# Altium schematic sheet peripherials.SchDoc (part 1 of 2)
size 420 x 297 mm; SheetNumber: 5; SheetTotal: 5
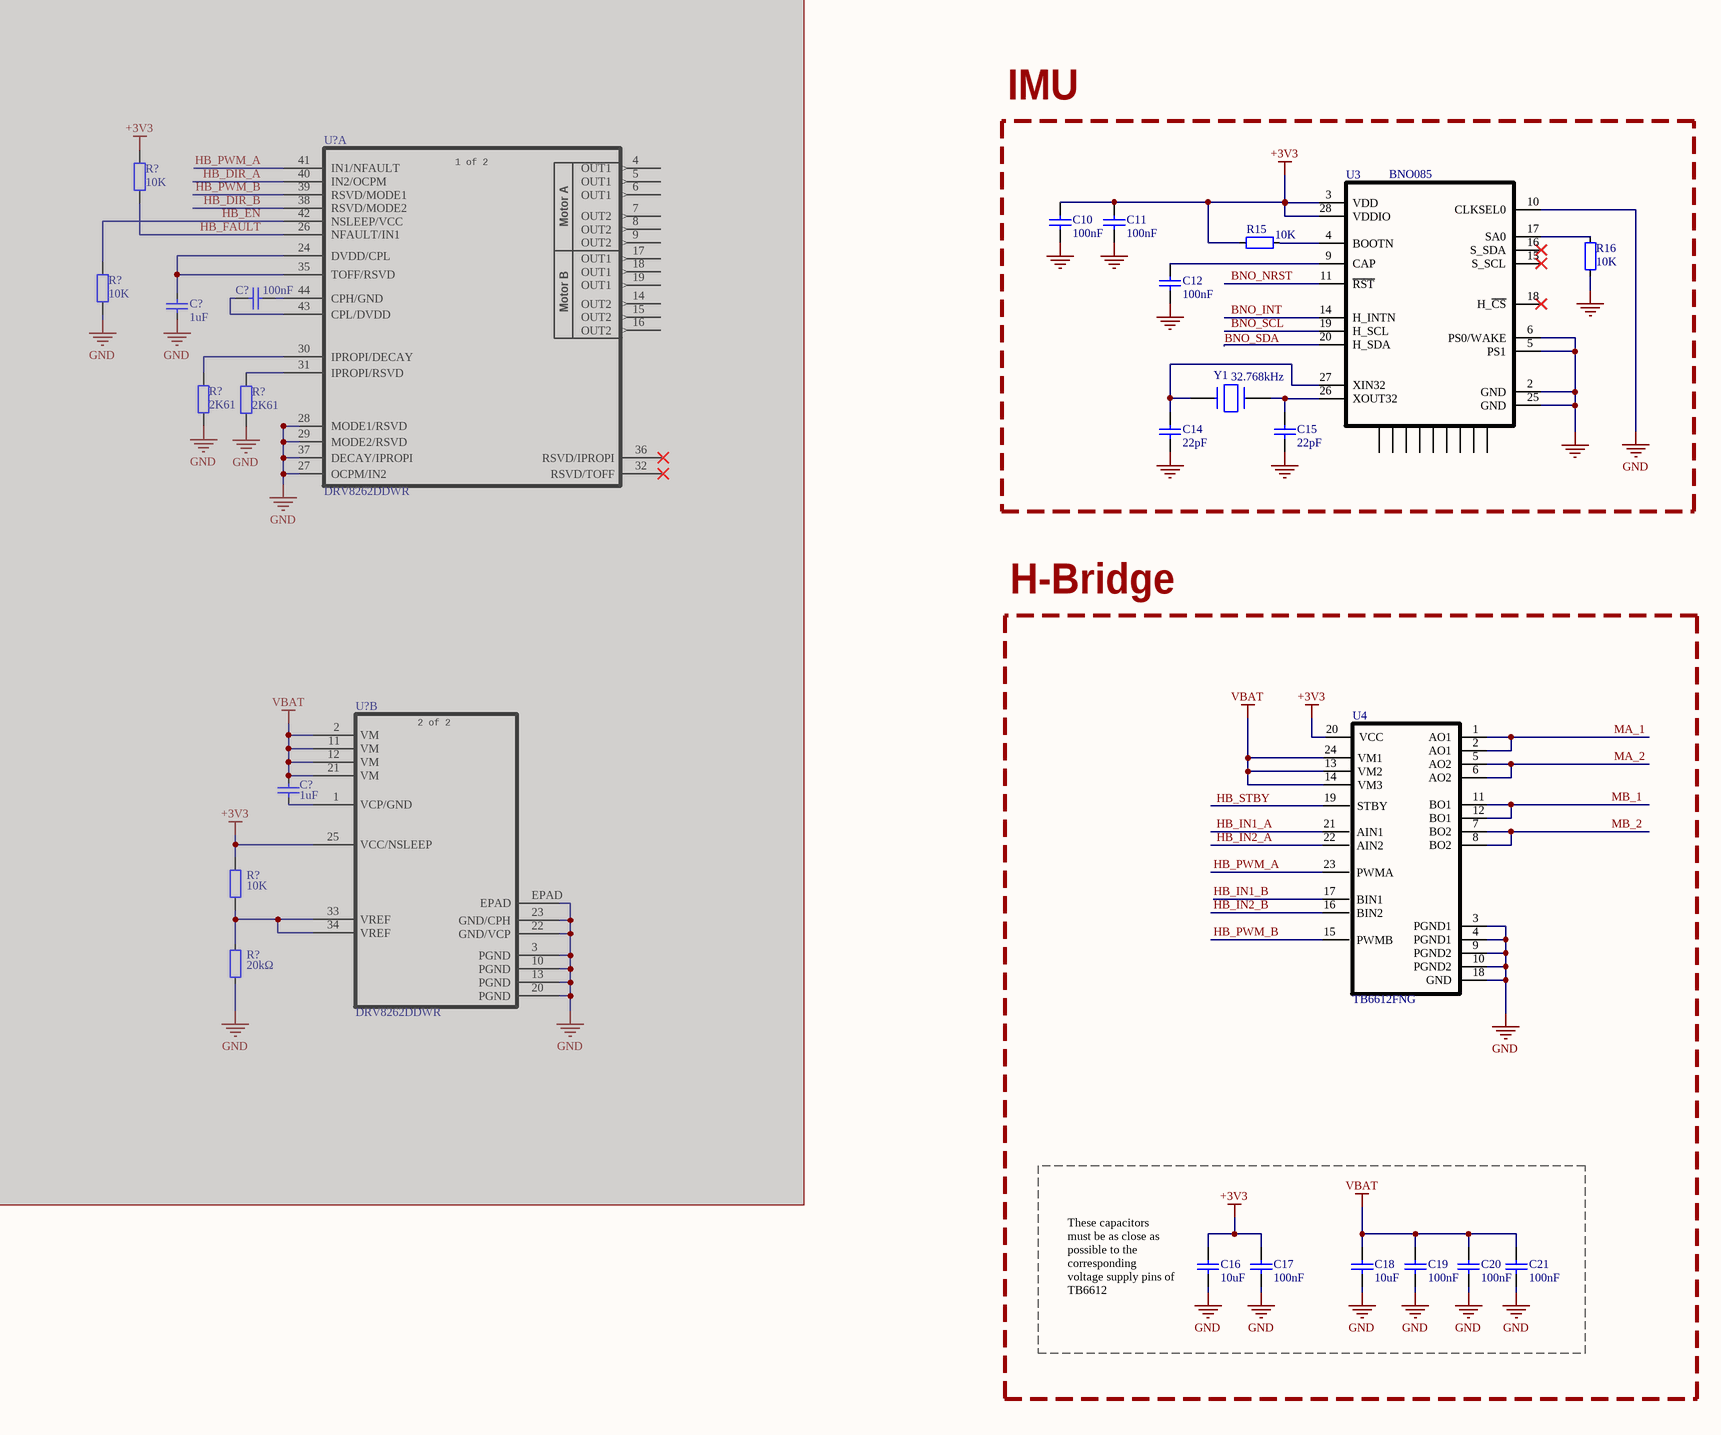
[diagram p0: peripherials.SchDoc, left]
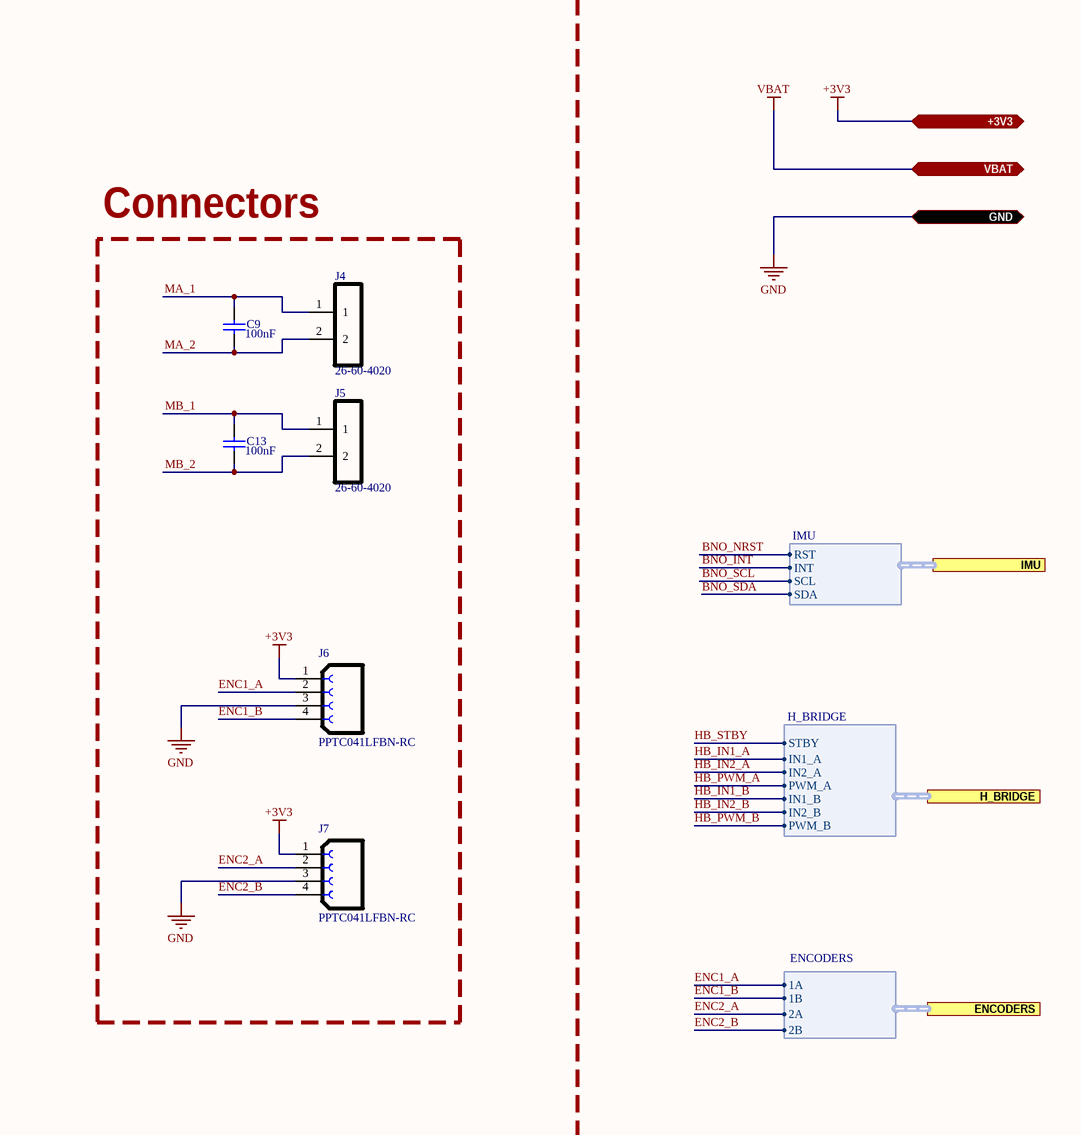
[diagram p1: peripherials.SchDoc, right]

## Parts
(Parts that share a designator on the sheet are numbered #1, #2 ... from top to bottom, then left to right.)
C9  value 100nF  [C0402_H0P7]  (hidden comment: CGA2B3X7R1H104K050BB)
C10  value 100nF  [C0402_H0P7]  (hidden comment: GRM155R71C104JA88D)
C11  value 100nF  [C0402_H0P7]  (hidden comment: GRM155R71C104JA88D)
C12  value 100nF  [C0402_H0P7]  (hidden comment: GRM155R71C104JA88D)
C13  value 100nF  [C0402_H0P7]  (hidden comment: CGA2B3X7R1H104K050BB)
C14  value 22pF  [C0402_H0P7]  (hidden comment: CC0402JRNPO9BN220)
C15  value 22pF  [C0402_H0P7]  (hidden comment: CC0402JRNPO9BN220)
C16  value 10uF  [C0805_H1P45]  (hidden comment: GRM21BR61E106KA73K)
C17  value 100nF  [C0402_H0P7]  (hidden comment: GRM155R71E104KE14J)
C18  value 10uF  [C0805_H1P45]  (hidden comment: GRM21BR61E106KA73K)
C19  value 100nF  [C0402_H0P7]  (hidden comment: GRM155R71E104KE14J)
C20  value 100nF  [C0402_H0P7]  (hidden comment: GRM155R71E104KE14J)
C21  value 100nF  [C0402_H0P7]  (hidden comment: GRM155R71E104KE14J)
C?#1  value 1uF  [CAP0603-M]  (hidden comment: CL10B105KA8NNNC)  (masked out: inside a compile mask, not in the netlist)
C?#2  value 100nF  [C0402_H0P7]  (hidden comment: CGA2B3X7R1H104K050BB)  (masked out: inside a compile mask, not in the netlist)
C?#3  value 1uF  [CAP0805-M]  (hidden comment: GCM21BR71H105KA03L)  (masked out: inside a compile mask, not in the netlist)
J4  26-60-4020  [FP-26-60-4020-MFG]
J5  26-60-4020  [FP-26-60-4020-MFG]
J6  PPTC041LFBN-RC  [SULLINS_PPTC041LFBN-RC]
J7  PPTC041LFBN-RC  [SULLINS_PPTC041LFBN-RC]
R15  value 10K  [RES0402-M]  (hidden comment: RC0402FR-0710KL)
R16  value 10K  [RES0402-M]  (hidden comment: RC0402FR-0710KL)
R?#1  value 10K  [R0402_H0P4]  (hidden comment: RC0402FR-0710KL)  (masked out: inside a compile mask, not in the netlist)
R?#2  value 10K  [R0402_H0P4]  (hidden comment: RC0402FR-0710KL)  (masked out: inside a compile mask, not in the netlist)
R?#3  2K61  [R0603_H0P45]  (masked out: inside a compile mask, not in the netlist)
R?#4  2K61  [R0603_H0P45]  (masked out: inside a compile mask, not in the netlist)
R?#5  value 10K  [R0402_H0P4]  (hidden comment: RC0402FR-0710KL)  (masked out: inside a compile mask, not in the netlist)
R?#6  value 20kΩ  [RES0402-M]  (hidden comment: RC0402FR-0720KL)  (masked out: inside a compile mask, not in the netlist)
U3  BNO085  [FP-BNO085-MFG]
U4  TB6612FNG  [TOSH-SSOP-24_N]
U?#1  DRV8262DDWR  [HTSSOP44-DDW_TEX]  (part A of 2)  (masked out: inside a compile mask, not in the netlist)
U?#2  DRV8262DDWR  [HTSSOP44-DDW_TEX]  (part B of 2)  (masked out: inside a compile mask, not in the netlist)
Y1  Frequency: 32.768kHz  [FP-ABS07-MFG]  (hidden comment: ABS07-32.768KHZ-T)

## Blocks framed on the sheet
IMU: C10-C12 C14 C15 R15 R16 U3 Y1
Connectors: C9 C13 J4-J7
H-Bridge: C16-C21 U4

## Ports
+3V3 (bidir, see block_diagram[6C], logic_control[8A], power_supply[8A]), ENCODERS (harness ENCODERS, see block_diagram[6C], logic_control[8E]), GND (bidir, see block_diagram[6D], logic_control[8B], power_supply[8B]), H_BRIDGE (harness H_BRIDGE, see block_diagram[6C], logic_control[8D]), IMU (harness IMU, see block_diagram[6C], logic_control[8C]), VBAT (bidir, see block_diagram[6C], logic_control[8A], power_supply[8A])

## Harnesses
H_BRIDGE: STBY, IN1_A, IN2_A, PWM_A, IN1_B, IN2_B, PWM_B
ENCODERS: 2A, 1B, 1A, 2B
IMU: RST, INT, SCL, SDA

## Nets
+3V3: C10.1 C11.1 C16.1 C17.1 J6.1 J7.1 R15.1 U3.3(VDD) U3.28(VDDIO) U4.20(VCC) ; port +3V3
GND: C10.2 C11.2 C12.2 C14.2 C15.2 C16.2 C17.2 C18.2 C19.2 C20.2 C21.2 J6.3 J7.3 R16.2 U3.2(GND) U3.5(PS1) U3.6(PS0/WAKE) U3.10(CLKSEL0) U3.25(GND) U4.3(PGND1) U4.4(PGND1) U4.9(PGND2) U4.10(PGND2) U4.18(GND) ; port GND
VBAT: C18.1 C19.1 C20.1 C21.1 U4.13(VM2) U4.14(VM3) U4.24(VM1) ; port VBAT
BNO_INT: U3.14(H_INTN) ; port IMU.INT
BNO_NRST: U3.11(~{RST}) ; port IMU.RST
BNO_SCL: U3.19(H_SCL) ; port IMU.SCL
BNO_SDA: U3.20(H_SDA) ; port IMU.SDA
ENC1_A: J6.2 ; port ENCODERS.1A
ENC1_B: J6.4 ; port ENCODERS.1B
ENC2_A: J7.2 ; port ENCODERS.2A
ENC2_B: J7.4 ; port ENCODERS.2B
HB_IN1_A: U4.21(AIN1) ; port H_BRIDGE.IN1_A
HB_IN1_B: U4.17(BIN1) ; port H_BRIDGE.IN1_B
HB_IN2_A: U4.22(AIN2) ; port H_BRIDGE.IN2_A
HB_IN2_B: U4.16(BIN2) ; port H_BRIDGE.IN2_B
HB_PWM_A: U4.23(PWMA) ; port H_BRIDGE.PWM_A
HB_PWM_B: U4.15(PWMB) ; port H_BRIDGE.PWM_B
HB_STBY: U4.19(STBY) ; port H_BRIDGE.STBY
MA_1: C9.1 J4.1 U4.1(AO1) U4.2(AO1)
MA_2: C9.2 J4.2 U4.5(AO2) U4.6(AO2)
MB_1: C13.1 J5.1 U4.11(BO1) U4.12(BO1)
MB_2: C13.2 J5.2 U4.7(BO2) U4.8(BO2)
NetC12_1: C12.1 U3.9(CAP)
NetC14_1: C14.1 U3.27(XIN32) Y1.1
NetC15_1: C15.1 U3.26(XOUT32) Y1.2
NetR15_2: R15.2 U3.4(BOOTN)
NetR16_1: R16.1 U3.17(SA0)

Not connected (* = marked no-connect by the designer): U3 1(Reserved) 7(Reserved) 8(Reserved) 12(Reserved) 13(Reserved) 15(S_SCL)* 16(S_SDA)* 18(H_~{CS})* 21(Reserved) 22(Reserved) 23(Reserved) 24(Reserved)

## Notes on the sheet
- (near C16) These capacitors must be as close as possible to the corresponding voltage supply pins of TB6612
- Título:
- Equipe de Robótica Titans
- Projeto:
- Autor:
- Número:
- Aprovado por:
- Revisão:
- Data:
- Última Modificação:
- Página
- De
- (in symbol DRV8262DDWR, part A) 1 of 2; Motor A; Motor B
- (in symbol DRV8262DDWR, part B) 2 of 2